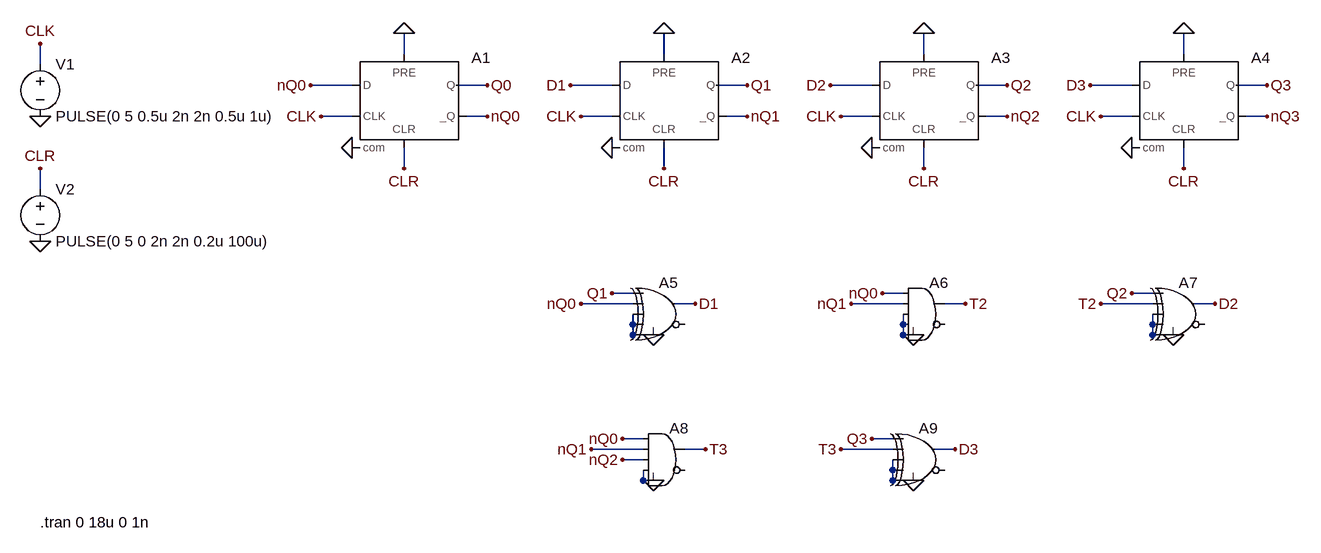
[diagram p0: schematic sync_down_counter.asc]
sync_down_counter.asc, the LTspice schematic file:
Version 4
SHEET 1 2288 1088
WIRE -144 48 -80 48
WIRE -128 96 -80 96
WIRE 0 176 0 144
WIRE 0 -32 0 0
WIRE 128 48 80 48
WIRE 128 96 96 96
WIRE 256 48 320 48
WIRE 272 96 320 96
WIRE 400 176 400 144
WIRE 400 -32 400 0
WIRE 528 48 480 48
WIRE 528 96 496 96
WIRE 656 48 720 48
WIRE 672 96 720 96
WIRE 800 176 800 144
WIRE 800 -32 800 0
WIRE 928 48 880 48
WIRE 928 96 896 96
WIRE 1056 48 1120 48
WIRE 1072 96 1120 96
WIRE 1200 176 1200 144
WIRE 1200 -32 1200 0
WIRE 1328 48 1280 48
WIRE 1328 96 1296 96
WIRE 320 368 352 368
WIRE 272 384 352 384
WIRE 352 416 352 400
WIRE 352 432 352 416
WIRE 384 432 352 432
WIRE 448 384 416 384
WIRE 736 368 768 368
WIRE 688 384 768 384
WIRE 768 416 768 400
WIRE 768 432 768 416
WIRE 784 432 768 432
WIRE 864 384 832 384
WIRE 1120 368 1152 368
WIRE 1072 384 1152 384
WIRE 1152 416 1152 400
WIRE 1152 432 1152 416
WIRE 1184 432 1152 432
WIRE 1248 384 1216 384
WIRE 336 592 368 592
WIRE 288 608 368 608
WIRE 336 624 368 624
WIRE 368 656 368 640
WIRE 384 656 368 656
WIRE 464 608 432 608
WIRE 720 592 752 592
WIRE 672 608 752 608
WIRE 752 640 752 624
WIRE 752 656 752 640
WIRE 784 656 752 656
WIRE 848 608 816 608
WIRE -560 -16 -560 16
WIRE -560 176 -560 208
FLAG -144 48 nQ0
FLAG -128 96 CLK
FLAG 0 176 CLR
FLAG 0 -32 0
FLAG -80 144 0
FLAG 128 48 Q0
FLAG 128 96 nQ0
FLAG 256 48 D1
FLAG 272 96 CLK
FLAG 400 176 CLR
FLAG 400 -32 0
FLAG 320 144 0
FLAG 528 48 Q1
FLAG 528 96 nQ1
FLAG 656 48 D2
FLAG 672 96 CLK
FLAG 800 176 CLR
FLAG 800 -32 0
FLAG 720 144 0
FLAG 928 48 Q2
FLAG 928 96 nQ2
FLAG 1056 48 D3
FLAG 1072 96 CLK
FLAG 1200 176 CLR
FLAG 1200 -32 0
FLAG 1120 144 0
FLAG 1328 48 Q3
FLAG 1328 96 nQ3
FLAG 320 368 Q1
FLAG 272 384 nQ0
FLAG 384 432 0
FLAG 448 384 D1
FLAG 736 368 nQ0
FLAG 688 384 nQ1
FLAG 784 432 0
FLAG 864 384 T2
FLAG 1120 368 Q2
FLAG 1072 384 T2
FLAG 1184 432 0
FLAG 1248 384 D2
FLAG 336 592 nQ0
FLAG 288 608 nQ1
FLAG 336 624 nQ2
FLAG 384 656 0
FLAG 464 608 T3
FLAG 720 592 Q3
FLAG 672 608 T3
FLAG 784 656 0
FLAG 848 608 D3
FLAG -560 -16 CLK
FLAG -560 96 0
FLAG -560 176 CLR
FLAG -560 288 0
SYMBOL Digital\\dflop 0 0 R0
SYMATTR InstName A1
SYMATTR SpiceLine Vhigh=5 Vlow=0 Ref=2.5 Td=10n
SYMBOL Digital\\dflop 400 0 R0
SYMATTR InstName A2
SYMATTR SpiceLine Vhigh=5 Vlow=0 Ref=2.5 Td=10n
SYMBOL Digital\\dflop 800 0 R0
SYMATTR InstName A3
SYMATTR SpiceLine Vhigh=5 Vlow=0 Ref=2.5 Td=10n
SYMBOL Digital\\dflop 1200 0 R0
SYMATTR InstName A4
SYMATTR SpiceLine Vhigh=5 Vlow=0 Ref=2.5 Td=10n
SYMBOL Digital\\xor 400 336 R0
SYMATTR InstName A5
SYMATTR SpiceLine Vhigh=5 Vlow=0 Ref=2.5 Td=10n
SYMBOL Digital\\and 800 336 R0
SYMATTR InstName A6
SYMATTR SpiceLine Vhigh=5 Vlow=0 Ref=2.5 Td=10n
SYMBOL Digital\\xor 1200 336 R0
SYMATTR InstName A7
SYMATTR SpiceLine Vhigh=5 Vlow=0 Ref=2.5 Td=10n
SYMBOL Digital\\and 400 560 R0
SYMATTR InstName A8
SYMATTR SpiceLine Vhigh=5 Vlow=0 Ref=2.5 Td=10n
SYMBOL Digital\\xor 800 560 R0
SYMATTR InstName A9
SYMATTR SpiceLine Vhigh=5 Vlow=0 Ref=2.5 Td=10n
SYMBOL voltage -560 0 R0
SYMATTR InstName V1
SYMATTR Value PULSE(0 5 0.5u 2n 2n 0.5u 1u)
SYMBOL voltage -560 192 R0
SYMATTR InstName V2
SYMATTR Value PULSE(0 5 0 2n 2n 0.2u 100u)
TEXT -560 720 Left 2 !.tran 0 18u 0 1n

The netlist it stands for:
* sync_down_counter.asc
A1 nQ0 0 CLK 0 CLR nQ0 Q0 0 DFLOP Vhigh=5 Vlow=0 Ref=2.5 Td=10n
A2 D1 0 CLK 0 CLR nQ1 Q1 0 DFLOP Vhigh=5 Vlow=0 Ref=2.5 Td=10n
A3 D2 0 CLK 0 CLR nQ2 Q2 0 DFLOP Vhigh=5 Vlow=0 Ref=2.5 Td=10n
A4 D3 0 CLK 0 CLR nQ3 Q3 0 DFLOP Vhigh=5 Vlow=0 Ref=2.5 Td=10n
A5 Q1 nQ0 0 0 0 0 D1 0 XOR Vhigh=5 Vlow=0 Ref=2.5 Td=10n
A6 nQ0 nQ1 0 0 0 0 T2 0 AND Vhigh=5 Vlow=0 Ref=2.5 Td=10n
A7 Q2 T2 0 0 0 0 D2 0 XOR Vhigh=5 Vlow=0 Ref=2.5 Td=10n
A8 nQ0 nQ1 nQ2 0 0 0 T3 0 AND Vhigh=5 Vlow=0 Ref=2.5 Td=10n
A9 Q3 T3 0 0 0 0 D3 0 XOR Vhigh=5 Vlow=0 Ref=2.5 Td=10n
V1 CLK 0 PULSE(0 5 0.5u 2n 2n 0.5u 1u)
V2 CLR 0 PULSE(0 5 0 2n 2n 0.2u 100u)
.tran 0 18u 0 1n
.backanno
.end